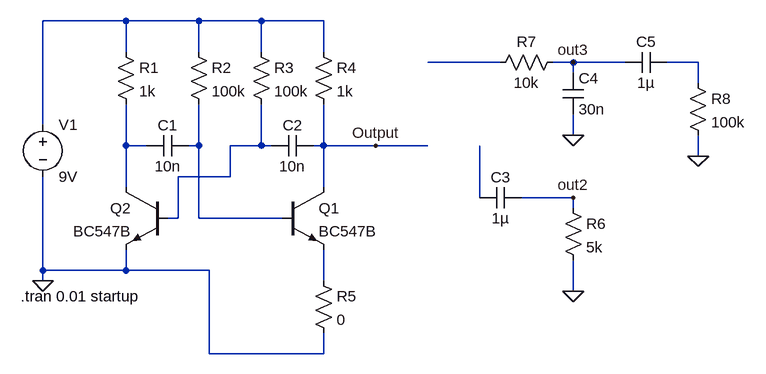
[diagram p0: schematic astable_multivibrator.asc]
astable_multivibrator.asc, the LTspice schematic file:
Version 4
SHEET 1 1044 680
WIRE 80 0 -48 0
WIRE 192 0 80 0
WIRE 288 0 192 0
WIRE 384 0 288 0
WIRE 80 48 80 0
WIRE 192 48 192 0
WIRE 288 48 288 0
WIRE 384 48 384 0
WIRE 656 64 544 64
WIRE 768 64 736 64
WIRE 848 64 768 64
WIRE 960 64 912 64
WIRE 768 80 768 64
WIRE 960 96 960 64
WIRE -48 160 -48 0
WIRE 768 176 768 144
WIRE 80 192 80 128
WIRE 112 192 80 192
WIRE 192 192 192 128
WIRE 192 192 176 192
WIRE 288 192 288 128
WIRE 288 192 240 192
WIRE 304 192 288 192
WIRE 384 192 384 128
WIRE 384 192 368 192
WIRE 464 192 384 192
WIRE 544 192 464 192
WIRE 960 208 960 176
WIRE 240 240 240 192
WIRE 240 240 160 240
WIRE 80 256 80 192
WIRE 384 256 384 192
WIRE 624 272 624 192
WIRE 768 272 688 272
WIRE 768 288 768 272
WIRE 160 304 160 240
WIRE 160 304 144 304
WIRE 192 304 192 192
WIRE 320 304 192 304
WIRE -48 384 -48 240
WIRE 80 384 80 352
WIRE 80 384 -48 384
WIRE 208 384 80 384
WIRE -48 400 -48 384
WIRE 384 400 384 352
WIRE 768 416 768 368
WIRE 208 512 208 384
WIRE 384 512 384 480
WIRE 384 512 208 512
FLAG -48 400 0
FLAG 464 192 Output
FLAG 768 416 0
FLAG 768 272 out2
FLAG 768 176 0
FLAG 768 64 out3
FLAG 960 208 0
SYMBOL voltage -48 144 R0
WINDOW 123 0 0 Left 2
WINDOW 39 0 0 Left 2
SYMATTR InstName V1
SYMATTR Value 9V
SYMBOL res 64 32 R0
SYMATTR InstName R1
SYMATTR Value 1k
SYMBOL res 176 32 R0
SYMATTR InstName R2
SYMATTR Value 100k
SYMBOL res 272 32 R0
SYMATTR InstName R3
SYMATTR Value 100k
SYMBOL res 368 32 R0
SYMATTR InstName R4
SYMATTR Value 1k
SYMBOL cap 176 176 R90
WINDOW 0 0 32 VBottom 2
WINDOW 3 32 32 VTop 2
SYMATTR InstName C1
SYMATTR Value 10n
SYMATTR SpiceLine V=16 Irms=247m Rser=0.759039 Lser=0 mfg="KEMET" pn="C0603C103K4RAC" type="X7R"
SYMBOL cap 368 176 R90
WINDOW 0 0 32 VBottom 2
WINDOW 3 32 32 VTop 2
SYMATTR InstName C2
SYMATTR Value 10n
SYMATTR SpiceLine V=16 Irms=247m Rser=0.759039 Lser=0 mfg="KEMET" pn="C0603C103K4RAC" type="X7R"
SYMBOL npn 320 256 R0
SYMATTR InstName Q1
SYMATTR Value BC547B
SYMBOL npn 144 256 M0
SYMATTR InstName Q2
SYMATTR Value BC547B
SYMBOL res 368 384 R0
SYMATTR InstName R5
SYMATTR Value 0
SYMBOL cap 688 256 R90
WINDOW 0 0 32 VBottom 2
WINDOW 3 32 32 VTop 2
SYMATTR InstName C3
SYMATTR Value 1µ
SYMBOL res 752 272 R0
SYMATTR InstName R6
SYMATTR Value 5k
SYMBOL res 752 48 R90
WINDOW 0 0 56 VBottom 2
WINDOW 3 32 56 VTop 2
SYMATTR InstName R7
SYMATTR Value 10k
SYMBOL cap 752 80 R0
SYMATTR InstName C4
SYMATTR Value 30n
SYMBOL cap 912 48 R90
WINDOW 0 0 32 VBottom 2
WINDOW 3 32 32 VTop 2
SYMATTR InstName C5
SYMATTR Value 1µ
SYMBOL res 944 80 R0
SYMATTR InstName R8
SYMATTR Value 100k
TEXT -82 424 Left 2 !.tran 0.01 startup

The netlist it stands for:
* astable_multivibrator.asc
V1 N001 0 9V
R1 N001 N004 1k
R2 N001 N005 100k
R3 N001 N006 100k
R4 N001 Output 1k
C1 N005 N004 10n V=16 Irms=247m Rser=0.759039 Lser=0 mfg="KEMET" pn="C0603C103K4RAC" type="X7R"
C2 Output N006 10n V=16 Irms=247m Rser=0.759039 Lser=0 mfg="KEMET" pn="C0603C103K4RAC" type="X7R"
Q1 Output N005 N008 0 BC547B
Q2 N004 N006 0 0 BC547B
R5 N008 0 0
C3 out2 N007 1µ
R6 out2 0 5k
R7 out3 N002 10k
C4 out3 0 30n
C5 N003 out3 1µ
R8 N003 0 100k
.model NPN NPN
.model PNP PNP
.lib standard.bjt
.tran 0.01 startup
.backanno
.end